# Altium schematic sheet LIS2HH12TR.schdoc
size 127 x 101 mm
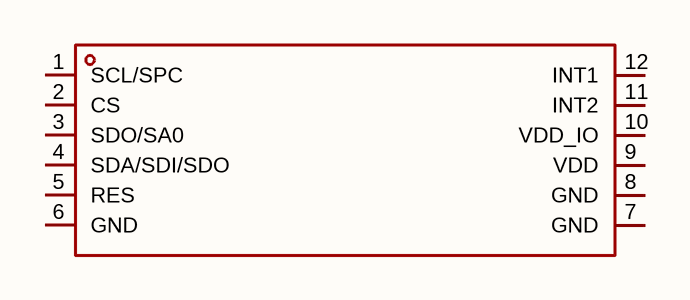
[diagram p0: LIS2HH12TR.schdoc]

## Parts
U?  lis2hh12tr  [LGA-12_L2.0-W2.0-P0.50-BL]  (value not drawn)

## Nets

Not connected (* = marked no-connect by the designer): U? 1(SCL/SPC) 2(CS) 3(SDO/SA0) 4(SDA/SDI/SDO) 5(RES) 6(GND) 7(GND) 8(GND) 9(VDD) 10(VDD_IO) 11(INT2) 12(INT1)

## Library data of the parts
U? = lis2hh12tr: Accelerometer Sensing Axis:X,Y,Z Acceleration Measurement Range (MAX):±8g Acceleration Measurement Range (MAX):±8g Gyroscope Sensing Axis:- Gyroscope Measurement Range (MAX):- Gyroscope Measurement Range (MAX):- Sensor Type:Accelerometer Output Bits:16bit; Manufacturer: ST(意法半导体); AddInBom: yes; ModelId: 08d0e00f89c34818888f739e33f11413; ModelName: LGA-12_L2.0-W2.0-H1.0-P0.50; ModelTransform: 78.74,78.74,0,90,0,0,0,0.001,0; Accelerometer Sensing Axis: X,Y,Z; Acceleration Measurement Range (MAX): ±8g; Output Bits: 16bit; Interface: I2C；SPI; Voltage - Supply: 1.71V~3.6V; Standby Current: 5uA; Symbol: LIS2HH12TR; LCSC Part Name: MEMS数字输出运动传感器:超低功耗高性能3轴“pico”加速度计; SupplierPart: C221446; ManufacturerPart: LIS2HH12TR; Supplier Footprint: LGA-12(2x2); JLCPCB Part Class: Extended Part; Datasheet: https://item.szlcsc.com/datasheet/LIS2HH12TR/221875.html; Supplier: LCSC; ConvertToPcb: yes; FootprintName: LGA-12_L2.0-W2.0-P0.50-BL; Gyroscope Sensing Axis: -; Gyroscope Measurement Range (MAX): -; Sensor Type: Accelerometer; Cache Size: -; Operating Temperature: -40℃~+85℃; Features: Motion event detection